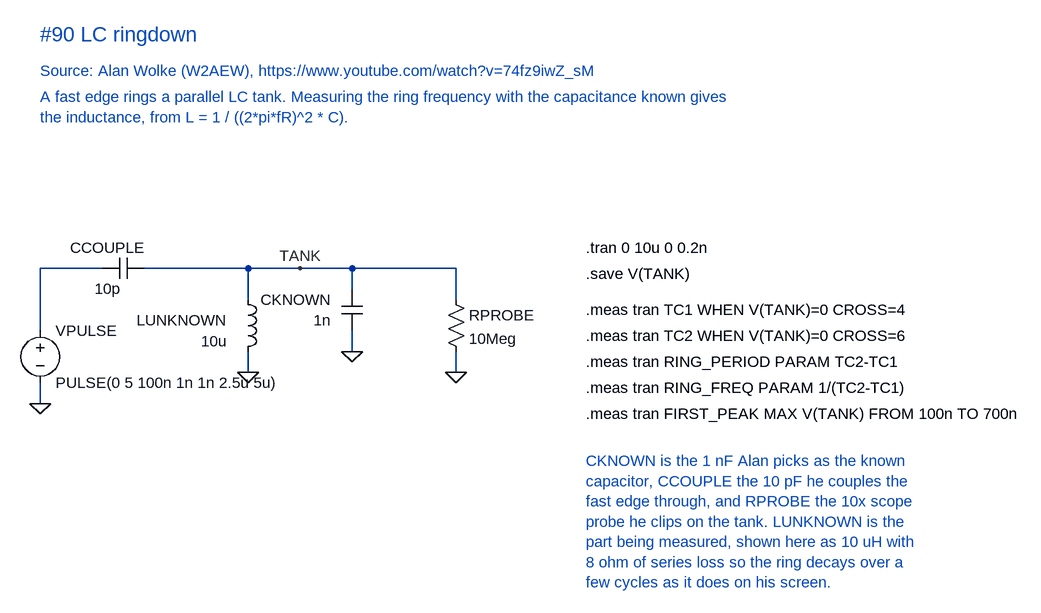
[diagram p0: schematic LC ringdown.asc]
LC ringdown.asc, the LTspice schematic file:
Version 4.1
SHEET 1 900 640
WIRE 0 128 96 128
WIRE 160 128 320 128
WIRE 320 128 480 128
WIRE 480 128 640 128
WIRE 0 224 0 128
WIRE 0 336 0 304
WIRE 320 176 320 128
WIRE 320 288 320 256
WIRE 480 160 480 128
WIRE 480 256 480 224
WIRE 640 176 640 128
WIRE 640 288 640 256
FLAG 0 336 0
FLAG 320 288 0
FLAG 480 256 0
FLAG 640 288 0
FLAG 400 128 TANK
SYMBOL voltage 0 208 R0
SYMATTR InstName VPULSE
SYMATTR Value PULSE(0 5 100n 1n 1n 2.5u 5u)
SYMBOL cap 160 112 R90
WINDOW 0 0 56 VBottom 2
WINDOW 3 32 56 VTop 2
SYMATTR InstName CCOUPLE
SYMATTR Value 10p
SYMBOL ind 304 160 R0
WINDOW 0 -16 48 Right 2
WINDOW 3 -16 80 Right 2
SYMATTR InstName LUNKNOWN
SYMATTR Value 10u
SYMATTR SpiceLine Rser=8
SYMBOL cap 464 160 R0
WINDOW 0 -16 16 Right 2
WINDOW 3 -16 48 Right 2
SYMATTR InstName CKNOWN
SYMATTR Value 1n
SYMBOL res 624 160 R0
SYMATTR InstName RPROBE
SYMATTR Value 10Meg
TEXT 0 -232 Left 3 ;#90 LC ringdown
TEXT 0 -176 Left 2 ;Source: Alan Wolke (W2AEW), https://www.youtube.com/watch?v=74fz9iwZ_sM
TEXT 0 -136 Left 2 ;A fast edge rings a parallel LC tank. Measuring the ring frequency with the capacitance known gives\nthe inductance, from L = 1 / ((2*pi*fR)^2 * C).
TEXT 840 96 Left 2 !.tran 0 10u 0 0.2n
TEXT 840 136 Left 2 !.save V(TANK)
TEXT 840 192 Left 2 !.meas tran TC1 WHEN V(TANK)=0 CROSS=4
TEXT 840 232 Left 2 !.meas tran TC2 WHEN V(TANK)=0 CROSS=6
TEXT 840 272 Left 2 !.meas tran RING_PERIOD PARAM TC2-TC1
TEXT 840 312 Left 2 !.meas tran RING_FREQ PARAM 1/(TC2-TC1)
TEXT 840 352 Left 2 !.meas tran FIRST_PEAK MAX V(TANK) FROM 100n TO 700n
TEXT 840 424 Left 2 ;CKNOWN is the 1 nF Alan picks as the known\ncapacitor, CCOUPLE the 10 pF he couples the\nfast edge through, and RPROBE the 10x scope\nprobe he clips on the tank. LUNKNOWN is the\npart being measured, shown here as 10 uH with\n8 ohm of series loss so the ring decays over a\nfew cycles as it does on his screen.

The netlist it stands for:
* LC ringdown.asc
VPULSE N001 0 PULSE(0 5 100n 1n 1n 2.5u 5u)
CCOUPLE TANK N001 10p
LUNKNOWN TANK 0 10u Rser=8
CKNOWN TANK 0 1n
RPROBE TANK 0 10Meg
* #90 LC ringdown
* Source: Alan Wolke (W2AEW), https://www.youtube.com/watch?v=74fz9iwZ_sM
* A fast edge rings a parallel LC tank. Measuring the ring frequency with the capacitance known gives
* the inductance, from L = 1 / ((2*pi*fR)^2 * C).
.tran 0 10u 0 0.2n
.save V(TANK)
.meas tran TC1 WHEN V(TANK)=0 CROSS=4
.meas tran TC2 WHEN V(TANK)=0 CROSS=6
.meas tran RING_PERIOD PARAM TC2-TC1
.meas tran RING_FREQ PARAM 1/(TC2-TC1)
.meas tran FIRST_PEAK MAX V(TANK) FROM 100n TO 700n
* CKNOWN is the 1 nF Alan picks as the known
* capacitor, CCOUPLE the 10 pF he couples the
* fast edge through, and RPROBE the 10x scope
* probe he clips on the tank. LUNKNOWN is the
* part being measured, shown here as 10 uH with
* 8 ohm of series loss so the ring decays over a
* few cycles as it does on his screen.
.backanno
.end